# Altium project nexnclock_one_in12_6x_rev_2_0.PrjPcb
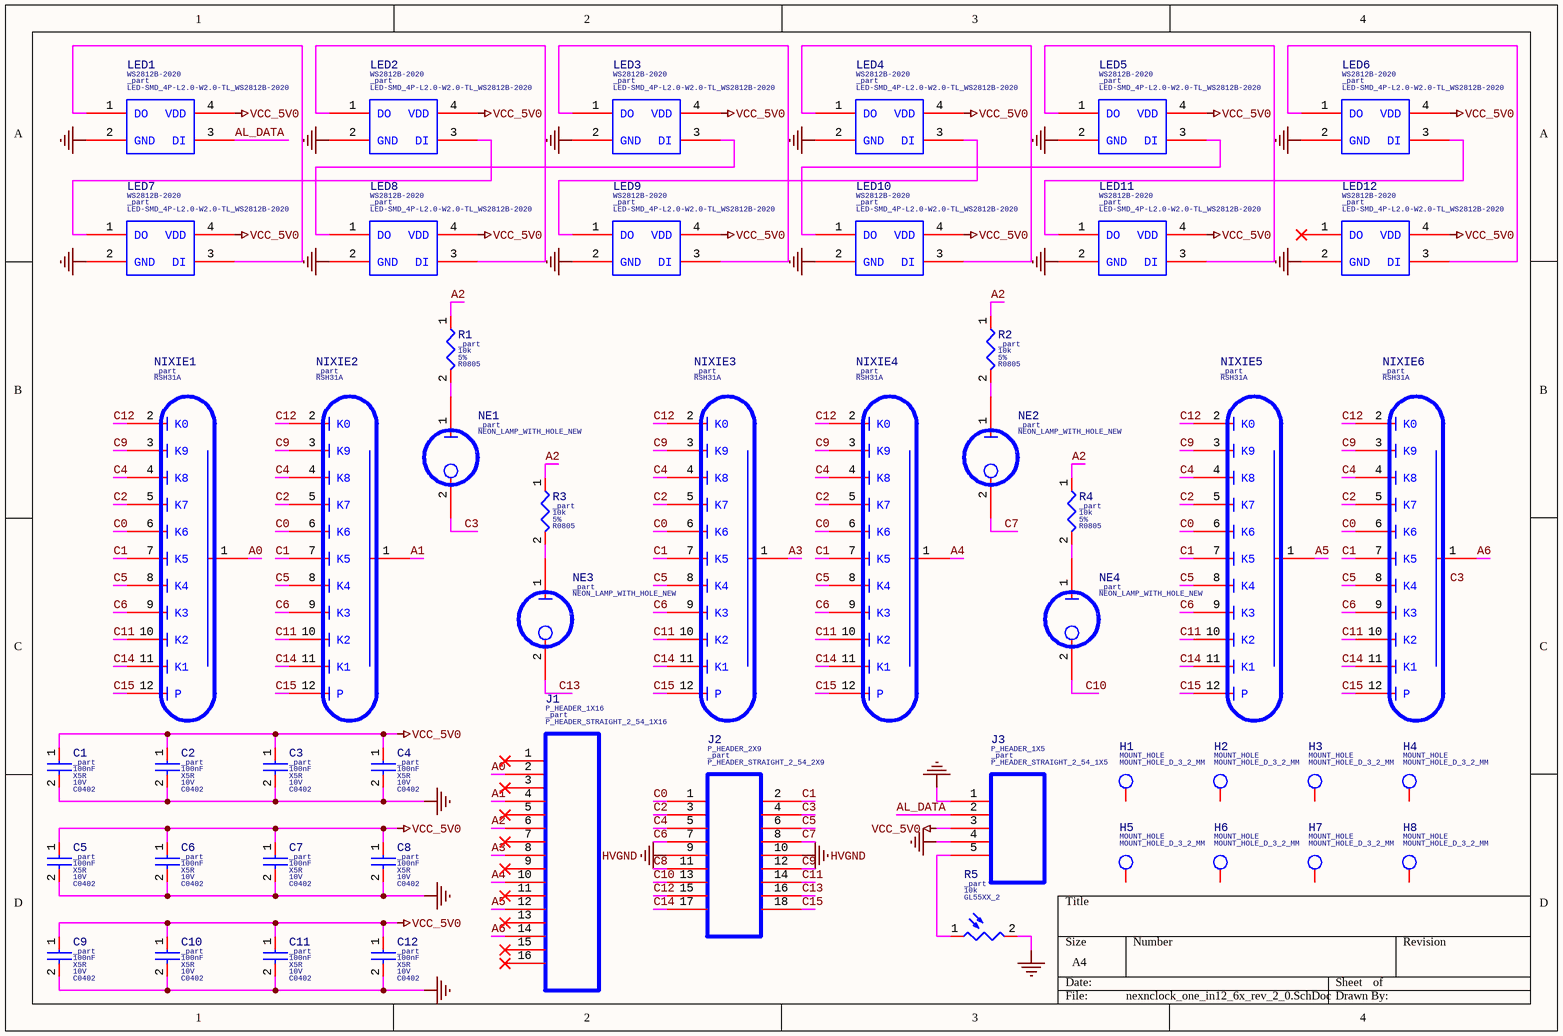
[diagram p0: nexnclock_one_in12_6x_rev_2_0.SchDoc]
1 sheet, 50 parts. Net scope: global (net labels, ports and power ports of the same name join across sheets).
Board files: nexnclock_one_in12_6x_rev_2_0.PcbDoc, multi_pcb.PcbDoc

## Sheet nexnclock_one_in12_6x_rev_2_0.SchDoc
size A4; SheetNumber: 1; SheetTotal: 1

### Parts
C1  value 100nF  Part Reference: _part  Voltage: 10V  Dielectric: X5R  [C0402]  (hidden comment: CAP)
C2  value 100nF  Part Reference: _part  Voltage: 10V  Dielectric: X5R  [C0402]  (hidden comment: CAP)
C3  value 100nF  Part Reference: _part  Voltage: 10V  Dielectric: X5R  [C0402]  (hidden comment: CAP)
C4  value 100nF  Part Reference: _part  Voltage: 10V  Dielectric: X5R  [C0402]  (hidden comment: CAP)
C5  value 100nF  Part Reference: _part  Voltage: 10V  Dielectric: X5R  [C0402]  (hidden comment: CAP)
C6  value 100nF  Part Reference: _part  Voltage: 10V  Dielectric: X5R  [C0402]  (hidden comment: CAP)
C7  value 100nF  Part Reference: _part  Voltage: 10V  Dielectric: X5R  [C0402]  (hidden comment: CAP)
C8  value 100nF  Part Reference: _part  Voltage: 10V  Dielectric: X5R  [C0402]  (hidden comment: CAP)
C9  value 100nF  Part Reference: _part  Voltage: 10V  Dielectric: X5R  [C0402]  (hidden comment: CAP)
C10  value 100nF  Part Reference: _part  Voltage: 10V  Dielectric: X5R  [C0402]  (hidden comment: CAP)
C11  value 100nF  Part Reference: _part  Voltage: 10V  Dielectric: X5R  [C0402]  (hidden comment: CAP)
C12  value 100nF  Part Reference: _part  Voltage: 10V  Dielectric: X5R  [C0402]  (hidden comment: CAP)
H1  MOUNT_HOLE  [MOUNT_HOLE_D_3_2_MM]  (no BOM)
H2  MOUNT_HOLE  [MOUNT_HOLE_D_3_2_MM]  (no BOM)
H3  MOUNT_HOLE  [MOUNT_HOLE_D_3_2_MM]  (no BOM)
H4  MOUNT_HOLE  [MOUNT_HOLE_D_3_2_MM]  (no BOM)
H5  MOUNT_HOLE  [MOUNT_HOLE_D_3_2_MM]  (no BOM)
H6  MOUNT_HOLE  [MOUNT_HOLE_D_3_2_MM]  (no BOM)
H7  MOUNT_HOLE  [MOUNT_HOLE_D_3_2_MM]  (no BOM)
H8  MOUNT_HOLE  [MOUNT_HOLE_D_3_2_MM]  (no BOM)
J1  P_HEADER_1X16  Part Reference: _part  [P_HEADER_STRAIGHT_2_54_1X16]
J2  P_HEADER_2X9  Part Reference: _part  [P_HEADER_STRAIGHT_2_54_2X9]
J3  P_HEADER_1X5  Part Reference: _part  [P_HEADER_STRAIGHT_2_54_1X5]
LED1  WS2812B-2020  Part Reference: _part  [LED-SMD_4P-L2.0-W2.0-TL_WS2812B-2020]
LED2  WS2812B-2020  Part Reference: _part  [LED-SMD_4P-L2.0-W2.0-TL_WS2812B-2020]
LED3  WS2812B-2020  Part Reference: _part  [LED-SMD_4P-L2.0-W2.0-TL_WS2812B-2020]
LED4  WS2812B-2020  Part Reference: _part  [LED-SMD_4P-L2.0-W2.0-TL_WS2812B-2020]
LED5  WS2812B-2020  Part Reference: _part  [LED-SMD_4P-L2.0-W2.0-TL_WS2812B-2020]
LED6  WS2812B-2020  Part Reference: _part  [LED-SMD_4P-L2.0-W2.0-TL_WS2812B-2020]
LED7  WS2812B-2020  Part Reference: _part  [LED-SMD_4P-L2.0-W2.0-TL_WS2812B-2020]
LED8  WS2812B-2020  Part Reference: _part  [LED-SMD_4P-L2.0-W2.0-TL_WS2812B-2020]
LED9  WS2812B-2020  Part Reference: _part  [LED-SMD_4P-L2.0-W2.0-TL_WS2812B-2020]
LED10  WS2812B-2020  Part Reference: _part  [LED-SMD_4P-L2.0-W2.0-TL_WS2812B-2020]
LED11  WS2812B-2020  Part Reference: _part  [LED-SMD_4P-L2.0-W2.0-TL_WS2812B-2020]
LED12  WS2812B-2020  Part Reference: _part  [LED-SMD_4P-L2.0-W2.0-TL_WS2812B-2020]
NE1  Part Reference: _part  [NEON_LAMP_WITH_HOLE_NEW]  (hidden comment: NEON_LAMP)  (no BOM)
NE2  Part Reference: _part  [NEON_LAMP_WITH_HOLE_NEW]  (hidden comment: NEON_LAMP)  (no BOM)
NE3  Part Reference: _part  [NEON_LAMP_WITH_HOLE_NEW]  (hidden comment: NEON_LAMP)  (no BOM)
NE4  Part Reference: _part  [NEON_LAMP_WITH_HOLE_NEW]  (hidden comment: NEON_LAMP)  (no BOM)
NIXIE1  Part Reference: _part  [RSH31A]  (hidden comment: IN-12)  (no BOM)
NIXIE2  Part Reference: _part  [RSH31A]  (hidden comment: IN-12)  (no BOM)
NIXIE3  Part Reference: _part  [RSH31A]  (hidden comment: IN-12)  (no BOM)
NIXIE4  Part Reference: _part  [RSH31A]  (hidden comment: IN-12)  (no BOM)
NIXIE5  Part Reference: _part  [RSH31A]  (hidden comment: IN-12)  (no BOM)
NIXIE6  Part Reference: _part  [RSH31A]  (hidden comment: IN-12)  (no BOM)
R1  value 10k  Tolerancy: 5%  Part Reference: _part  [R0805]  (hidden comment: RESISTOR)
R2  value 10k  Tolerancy: 5%  Part Reference: _part  [R0805]  (hidden comment: RESISTOR)
R3  value 10k  Tolerancy: 5%  Part Reference: _part  [R0805]  (hidden comment: RESISTOR)
R4  value 10k  Tolerancy: 5%  Part Reference: _part  [R0805]  (hidden comment: RESISTOR)
R5  value 10k  Part Reference: _part  [GL55XX_2]  (hidden comment: PHOTORESISTOR)

### Nets
GND: C1.2 C2.2 C3.2 C4.2 C5.2 C6.2 C7.2 C8.2 C9.2 C10.2 C11.2 C12.2 J3.1 J3.4 LED1.2(GND) LED2.2(GND) LED3.2(GND) LED4.2(GND) LED5.2(GND) LED6.2(GND) LED7.2(GND) LED8.2(GND) LED9.2(GND) LED10.2(GND) LED11.2(GND) LED12.2(GND) R5.2
HVGND: J2.9 J2.10
VCC_5V0: C1.1 C2.1 C3.1 C4.1 C5.1 C6.1 C7.1 C8.1 C9.1 C10.1 C11.1 C12.1 J3.3 LED1.4(VDD) LED2.4(VDD) LED3.4(VDD) LED4.4(VDD) LED5.4(VDD) LED6.4(VDD) LED7.4(VDD) LED8.4(VDD) LED9.4(VDD) LED10.4(VDD) LED11.4(VDD) LED12.4(VDD)
A0: J1.2 NIXIE1.1(ANODE)
A1: J1.4 NIXIE2.1(ANODE)
A2: J1.6 R1.1 R2.1 R3.1 R4.1
A3: J1.8 NIXIE3.1(ANODE)
A4: J1.10 NIXIE4.1(ANODE)
A5: J1.12 NIXIE5.1(ANODE)
A6: J1.14 NIXIE6.1(ANODE)
AL_DATA: J3.2 LED1.3(DI)
C0: J2.1 NIXIE1.6(K6) NIXIE2.6(K6) NIXIE3.6(K6) NIXIE4.6(K6) NIXIE5.6(K6) NIXIE6.6(K6)
C1: J2.2 NIXIE1.7(K5) NIXIE2.7(K5) NIXIE3.7(K5) NIXIE4.7(K5) NIXIE5.7(K5) NIXIE6.7(K5)
C2: J2.3 NIXIE1.5(K7) NIXIE2.5(K7) NIXIE3.5(K7) NIXIE4.5(K7) NIXIE5.5(K7) NIXIE6.5(K7)
C3: J2.4 NE1.2(CATHODE)
C4: J2.5 NIXIE1.4(K8) NIXIE2.4(K8) NIXIE3.4(K8) NIXIE4.4(K8) NIXIE5.4(K8) NIXIE6.4(K8)
C5: J2.6 NIXIE1.8(K4) NIXIE2.8(K4) NIXIE3.8(K4) NIXIE4.8(K4) NIXIE5.8(K4) NIXIE6.8(K4)
C6: J2.7 NIXIE1.9(K3) NIXIE2.9(K3) NIXIE3.9(K3) NIXIE4.9(K3) NIXIE5.9(K3) NIXIE6.9(K3)
C7: J2.8 NE2.2(CATHODE)
C8: J2.11
C9: J2.12 NIXIE1.3(K9) NIXIE2.3(K9) NIXIE3.3(K9) NIXIE4.3(K9) NIXIE5.3(K9) NIXIE6.3(K9)
C10: J2.13 NE4.2(CATHODE)
C11: J2.14 NIXIE1.10(K2) NIXIE2.10(K2) NIXIE3.10(K2) NIXIE4.10(K2) NIXIE5.10(K2) NIXIE6.10(K2)
C12: J2.15 NIXIE1.2(K0) NIXIE2.2(K0) NIXIE3.2(K0) NIXIE4.2(K0) NIXIE5.2(K0) NIXIE6.2(K0)
C13: J2.16 NE3.2(CATHODE)
C14: J2.17 NIXIE1.11(K1) NIXIE2.11(K1) NIXIE3.11(K1) NIXIE4.11(K1) NIXIE5.11(K1) NIXIE6.11(K1)
C15: J2.18 NIXIE1.12(P) NIXIE2.12(P) NIXIE3.12(P) NIXIE4.12(P) NIXIE5.12(P) NIXIE6.12(P)
NetJ3_5: J3.5 R5.1
NetLED1_1: LED1.1(DO) LED7.3(DI)
NetLED2_1: LED2.1(DO) LED8.3(DI)
NetLED2_3: LED2.3(DI) LED7.1(DO)
NetLED3_1: LED3.1(DO) LED9.3(DI)
NetLED3_3: LED3.3(DI) LED8.1(DO)
NetLED4_1: LED4.1(DO) LED10.3(DI)
NetLED4_3: LED4.3(DI) LED9.1(DO)
NetLED5_1: LED5.1(DO) LED11.3(DI)
NetLED5_3: LED5.3(DI) LED10.1(DO)
NetLED6_1: LED6.1(DO) LED12.3(DI)
NetLED6_3: LED6.3(DI) LED11.1(DO)
NetNE1_1: NE1.1(ANODE) R1.2
NetNE2_1: NE2.1(ANODE) R2.2
NetNE3_1: NE3.1(ANODE) R3.2
NetNE4_1: NE4.1(ANODE) R4.2

Not connected (* = marked no-connect by the designer): H1 1; H2 1; H3 1; H4 1; H5 1; H6 1; H7 1; H8 1; J1 1* 3* 5* 7* 9* 11* 13* 15* 16*; LED12 1(DO)*

### Notes on the sheet
- Labels drawn without touching a wire or pin: C3

### Library data of the parts
C1-C12 = CAP: Manufacturer: _manufacturer; PCB Footprint: C0402
H1-H8 = MOUNT_HOLE: Manufacturer: _manufacturer; Procurement Type: DNP; PCB Footprint: MOUNT_HOLE_D_3_2_MM
J1 = P_HEADER_1X16: Manufacturer: _manufacturer; PCB Footprint: P_HEADER_STRAIGHT_2_54_1X16
J2 = P_HEADER_2X9: Manufacturer: _manufacturer; PCB Footprint: P_HEADER_STRAIGHT_2_54_2X9
J3 = P_HEADER_1X5: Manufacturer: _manufacturer; PCB Footprint: P_HEADER_STRAIGHT_2_54_1X5
LED1-LED12 = WS2812B-2020: Manufacturer: _manufacturer; PCB Footprint: LED-SMD_4P-L2.0-W2.0-TL_WS2812B-2020
NE1-NE4 = NEON_LAMP: INS-1, IN-3; Manufacturer: USSR; Procurement Type: DNP; PCB Footprint: NEON_LAMP_WITH_HOLE_NEW
NIXIE1-NIXIE6 = IN-12: Manufacturer: USSR; Procurement Type: DNP; PCB Footprint: RSH31A
R1-R4 = RESISTOR: Manufacturer: _manufacturer; PCB Footprint: R0805
R5 = PHOTORESISTOR: Manufacturer: _manufacturer; PCB Footprint: GL55XX_2